# Altium schematic sheet [02] - BLOCK DIAGRAM.SchDoc
size A3; DocumentNumber: 2; SheetNumber: 2; SheetTotal: 4
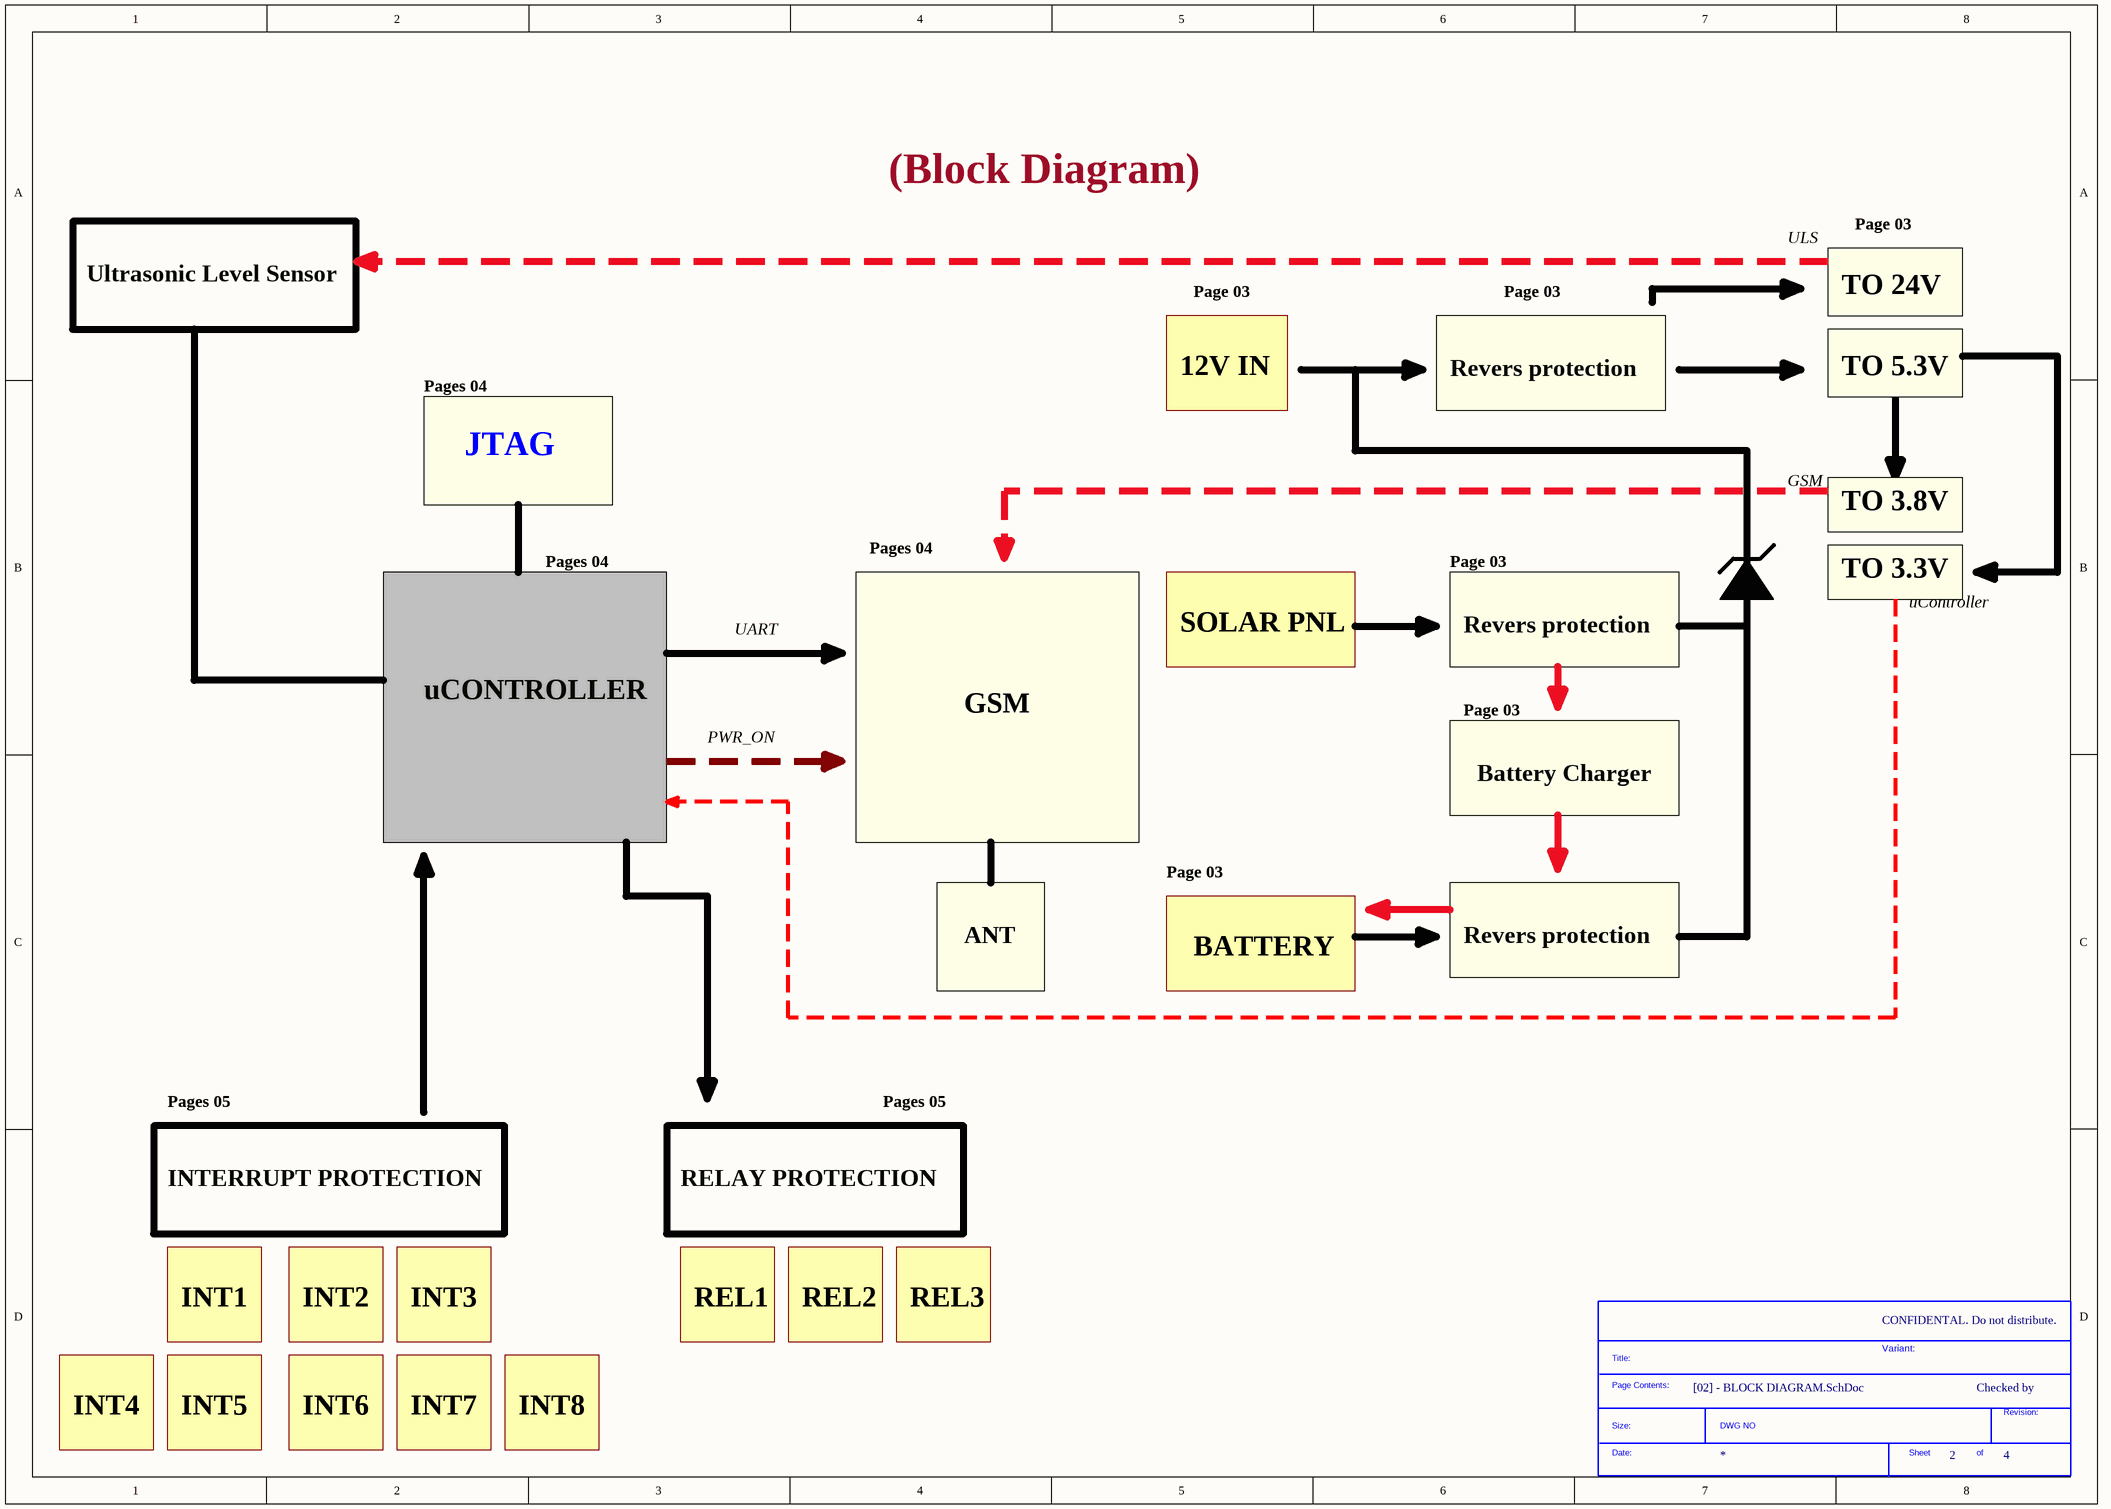
[diagram p0: [02] - BLOCK DIAGRAM.SchDoc]

## Parts
*  SDTitleBlock  (value not drawn)  (graphical)

## Notes on the sheet
- (Block Diagram)
- ULS
- Page 03
- Ultrasonic Level Sensor
- TO 24V
- 12V IN
- Revers protection
- TO 5.3V
- Pages 04
- JTAG
- GSM
- TO 3.8V
- TO 3.3V
- UART
- SOLAR PNL
- uController
- uCONTROLLER
- PWR_ON
- Battery Charger
- ANT
- BATTERY
- Pages 05
- INTERRUPT PROTECTION
- RELAY PROTECTION
- INT1
- INT2
- INT3
- REL1
- REL2
- REL3
- CONFIDENTAL. Do not distribute.
- Variant:
- Checked by
- INT4
- INT5
- INT6
- INT7
- INT8
- (in symbol SDTitleBlock) Title:; Page Contents:; Revision:; Size:; DWG NO; Date:; Sheet; of